# Altium schematic sheet LED_Status_Schematic.SchDoc: LED Status Schematic
size B; Date: 11/17/2026; ApprovedBy: Chris King; Author: Christopher King; Organization: ORGANIZATION; Address1: ADDRESS 1; Address2: ADDRESS 2; Address3: ADDRESS 3; Address4: ADDRESS 4; DocumentNumber: LED Status Board; Revision: -; SheetNumber: 1; SheetTotal: 3; Title2: LED Status Board; ENG_APP_DATE: --/--/--; DSN_APP_DATE: --/--/--; CHK_APP_DATE: --/--/--
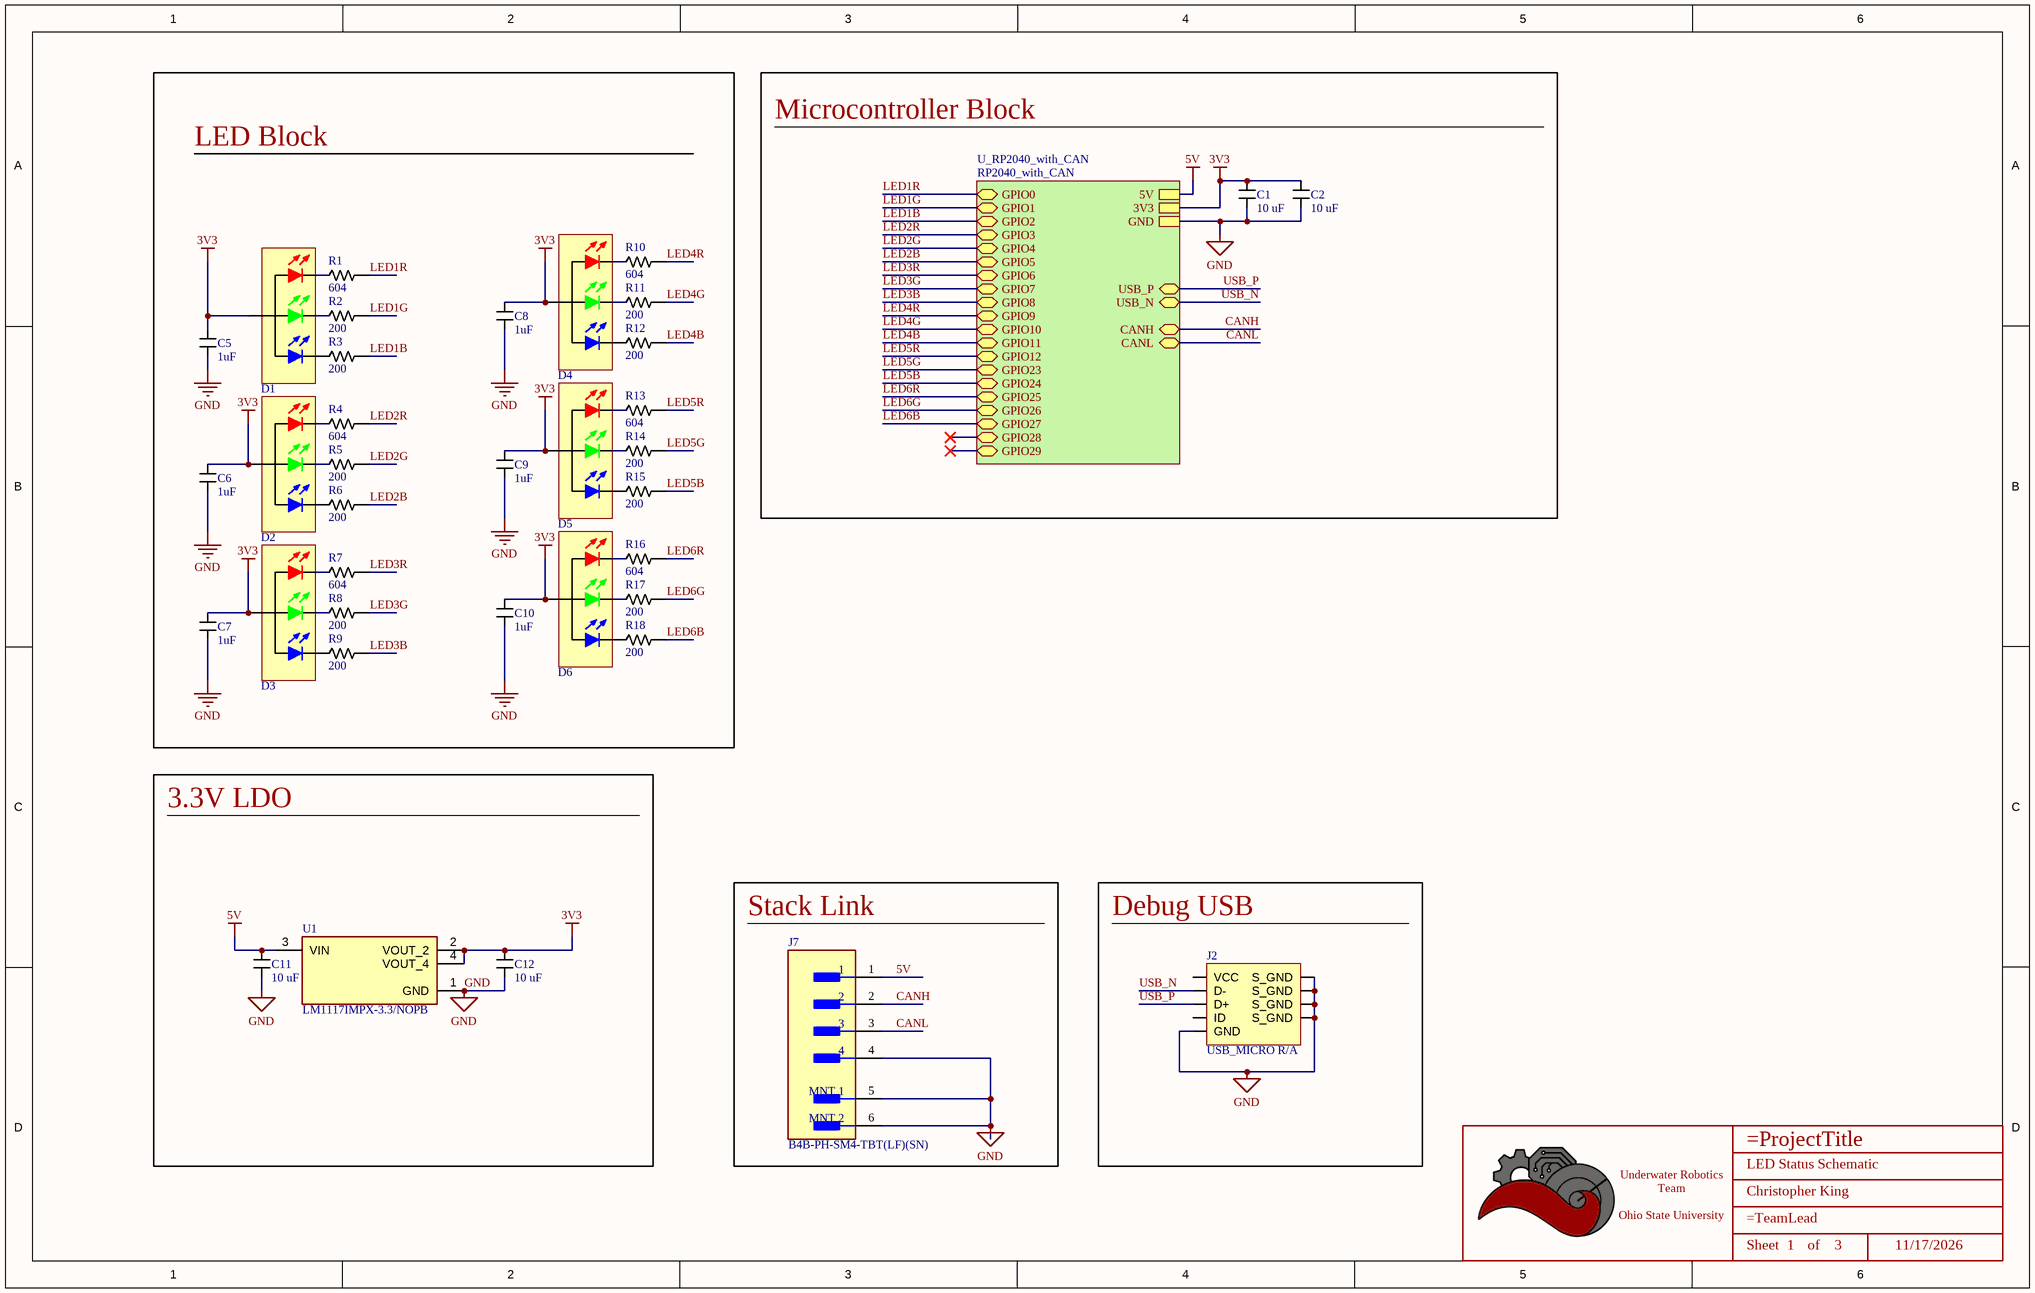
[diagram p0: LED_Status_Schematic.SchDoc]

## Parts
*  Title_Block  [LOGO]  (value not drawn)  (graphical)
C1  Value (uF): 10 uF  [CAPACITOR_0603]  (hidden comment: 10uF Ceramic 6.3V)
C2  Value (uF): 10 uF  [CAPACITOR_0603]  (hidden comment: 10uF Ceramic 6.3V)
C5  value 1uF  [CAPACITOR_0402]  (hidden comment: 1uF Ceramic 16V)
C6  value 1uF  [CAPACITOR_0402]  (hidden comment: 1uF Ceramic 16V)
C7  value 1uF  [CAPACITOR_0402]  (hidden comment: 1uF Ceramic 16V)
C8  value 1uF  [CAPACITOR_0402]  (hidden comment: 1uF Ceramic 16V)
C9  value 1uF  [CAPACITOR_0402]  (hidden comment: 1uF Ceramic 16V)
C10  value 1uF  [CAPACITOR_0402]  (hidden comment: 1uF Ceramic 16V)
C11  Value (uF): 10 uF  [CAPACITOR_0603]  (hidden comment: 10uF Ceramic 6.3V)
C12  Value (uF): 10 uF  [CAPACITOR_0603]  (hidden comment: 10uF Ceramic 6.3V)
D1  EAST1616RGBB4  [LED_0606_4SMD]  (value not drawn)
D2  EAST1616RGBB4  [LED_0606_4SMD]  (value not drawn)
D3  EAST1616RGBB4  [LED_0606_4SMD]  (value not drawn)
D4  EAST1616RGBB4  [LED_0606_4SMD]  (value not drawn)
D5  EAST1616RGBB4  [LED_0606_4SMD]  (value not drawn)
D6  EAST1616RGBB4  [LED_0606_4SMD]  (value not drawn)
J2  USB_MICRO R/A  [CONN_MINIUSB]
J7  B4B-PH-SM4-TBT(LF)(SN)  [FP-B4B-PH-SM4-TBT_LF_SN-MFG]
R1  Value  (Ohms): 604  [RESISTOR_0402]  (hidden comment: 604 Ohm 1% 1/16W)
R2  Value  (Ohms): 200  [RESISTOR_0402]  (hidden comment: 200 Ohm 1% 1/16W)
R3  Value  (Ohms): 200  [RESISTOR_0402]  (hidden comment: 200 Ohm 1% 1/16W)
R4  Value  (Ohms): 604  [RESISTOR_0402]  (hidden comment: 604 Ohm 1% 1/16W)
R5  Value  (Ohms): 200  [RESISTOR_0402]  (hidden comment: 200 Ohm 1% 1/16W)
R6  Value  (Ohms): 200  [RESISTOR_0402]  (hidden comment: 200 Ohm 1% 1/16W)
R7  Value  (Ohms): 604  [RESISTOR_0402]  (hidden comment: 604 Ohm 1% 1/16W)
R8  Value  (Ohms): 200  [RESISTOR_0402]  (hidden comment: 200 Ohm 1% 1/16W)
R9  Value  (Ohms): 200  [RESISTOR_0402]  (hidden comment: 200 Ohm 1% 1/16W)
R10  Value  (Ohms): 604  [RESISTOR_0402]  (hidden comment: 604 Ohm 1% 1/16W)
R11  Value  (Ohms): 200  [RESISTOR_0402]  (hidden comment: 200 Ohm 1% 1/16W)
R12  Value  (Ohms): 200  [RESISTOR_0402]  (hidden comment: 200 Ohm 1% 1/16W)
R13  Value  (Ohms): 604  [RESISTOR_0402]  (hidden comment: 604 Ohm 1% 1/16W)
R14  Value  (Ohms): 200  [RESISTOR_0402]  (hidden comment: 200 Ohm 1% 1/16W)
R15  Value  (Ohms): 200  [RESISTOR_0402]  (hidden comment: 200 Ohm 1% 1/16W)
R16  Value  (Ohms): 604  [RESISTOR_0402]  (hidden comment: 604 Ohm 1% 1/16W)
R17  Value  (Ohms): 200  [RESISTOR_0402]  (hidden comment: 200 Ohm 1% 1/16W)
R18  Value  (Ohms): 200  [RESISTOR_0402]  (hidden comment: 200 Ohm 1% 1/16W)
U1  LM1117IMPX-3.3/NOPB  [SOT-223-4]

## Blocks framed on the sheet
LED Block: C5-C10 D1-D6 R1-R18
Microcontroller Block: C1 C2
3.3V LDO: C11 C12 U1
Stack Link: J7
Debug USB: J2

## Sub-sheets
U_RP2040_with_CAN = RP2040_with_CAN: USB_P (bidir), USB_N (bidir), 5V, CANH (bidir), CANL (bidir), GPIO0 (bidir), GPIO1 (bidir), GPIO2 (bidir), GPIO3 (bidir), GPIO4 (bidir), GPIO5 (bidir), GPIO6 (bidir), GPIO7 (bidir), GPIO8 (bidir), GPIO9 (bidir), GPIO10 (bidir), GPIO11 (bidir), GPIO12 (bidir), GPIO23 (bidir), GPIO24 (bidir), GPIO25 (bidir), GPIO26 (bidir), GPIO27 (bidir), GPIO28 (bidir), GPIO29 (bidir), 3V3, GND

## Nets
3V3: C1.1 C2.1 C5.1 C6.1 C7.1 C8.1 C9.1 C10.1 C12.1 D1.4 D2.4 D3.4 D4.4 D5.4 D6.4 U1.2(VOUT_2) U1.4(VOUT_4) ; sheet U_RP2040_with_CAN/3V3
5V: C11.1 J7.1 U1.3(VIN) ; sheet U_RP2040_with_CAN/5V
GND: C1.2 C2.2 C5.2 C6.2 C7.2 C8.2 C9.2 C10.2 C11.2 C12.2 J2.5(GND) J2.6(S_GND) J2.7(S_GND) J2.8(S_GND) J2.9(S_GND) J7.4 J7.5(MNT_1) J7.6(MNT_2) U1.1(GND) ; sheet U_RP2040_with_CAN/GND
CANH: J7.2 ; sheet U_RP2040_with_CAN/CANH
CANL: J7.3 ; sheet U_RP2040_with_CAN/CANL
LED1B: R3.1 ; sheet U_RP2040_with_CAN/GPIO2
LED1G: R2.1 ; sheet U_RP2040_with_CAN/GPIO1
LED1R: R1.1 ; sheet U_RP2040_with_CAN/GPIO0
LED2B: R6.1 ; sheet U_RP2040_with_CAN/GPIO5
LED2G: R5.1 ; sheet U_RP2040_with_CAN/GPIO4
LED2R: R4.1 ; sheet U_RP2040_with_CAN/GPIO3
LED3B: R9.1 ; sheet U_RP2040_with_CAN/GPIO8
LED3G: R8.1 ; sheet U_RP2040_with_CAN/GPIO7
LED3R: R7.1 ; sheet U_RP2040_with_CAN/GPIO6
LED4B: R12.1 ; sheet U_RP2040_with_CAN/GPIO11
LED4G: R11.1 ; sheet U_RP2040_with_CAN/GPIO10
LED4R: R10.1 ; sheet U_RP2040_with_CAN/GPIO9
LED5B: R15.1 ; sheet U_RP2040_with_CAN/GPIO24
LED5G: R14.1 ; sheet U_RP2040_with_CAN/GPIO23
LED5R: R13.1 ; sheet U_RP2040_with_CAN/GPIO12
LED6B: R18.1 ; sheet U_RP2040_with_CAN/GPIO27
LED6G: R17.1 ; sheet U_RP2040_with_CAN/GPIO26
LED6R: R16.1 ; sheet U_RP2040_with_CAN/GPIO25
USB_N: J2.2(D-) ; sheet U_RP2040_with_CAN/USB_N
USB_P: J2.3(D+) ; sheet U_RP2040_with_CAN/USB_P
NetD1_1: D1.1 R1.2
NetD1_2: D1.2 R2.2
NetD2_1: D2.1 R4.2
NetD2_2: D2.2 R5.2
NetD3_1: D3.1 R7.2
NetD3_2: D3.2 R8.2
NetD4_1: D4.1 R10.2
NetD4_2: D4.2 R11.2
NetD5_1: D5.1 R13.2
NetD5_2: D5.2 R14.2
NetD6_1: D6.1 R16.2
NetD6_2: D6.2 R17.2

Not connected (* = marked no-connect by the designer): D1 3(32); D2 3(32); D3 3(32); D4 3(32); D5 3(32); D6 3(32); J2 1(VCC) 4(ID); R3 2; R6 2; R9 2; R12 2; R15 2; R18 2

## Notes on the sheet
- DWG. NO.
- REV.
- SHT.
- THIS DOCUMENT AND THE DATA DISCLOSED HEREIN OR HEREWITH IS THE PROPERTY OF ALTIUM LIMITED AND MAY BE FREELY DISTRIBUTED IN WHOLE. NO RIGHTS ARE RESERVED OR EXPRESS OR IMPLIED WARANTEE GIVEN.
- REVISION
- DESCRIPTION
- DATE
- APPROVED
- ENG:
- APPROVALS
- PROJECT
- DSN:
- CHK:
- REFERENCE DOCUMENTS
- PROJECT REVISION:
- TITLE
- DOCUMENT REVISION:
- DESIGN ITEM:
- BOM:
- FAB DWG:
- PCB DWG:
- ASSY DWG:
- SCALE:
- SIZE
- B
- CAGE CODE
- FILE NAME
- DWG NO.
- SHEET
- OF
- REV
- (in symbol Title_Block) Underwater Robotics Team / Ohio State University; Sheet; of

## Library data of the parts
* = Title_Block: UWRT Schematic Title Block Template / Created June 2021, Dylan Trainor
C1 C2 C11 C12 = CAPACITOR_10uF_0603: Cap 10uF 6.3V +/-20% / Ceramic 0603; Made By: Flip B; ComponentLink1Description: Digikey; ComponentLink1URL: https://www.digikey.com/en/products/detail/samsung-electro-mechanics/CL10A106MQ8NNNC/3886777; Supplier 1: Digi-Key; Supplier Part Number 1: 1276-1119-1-ND; Tolerance: +/- 20%; Voltage: 6.3V
C5-C10 = CAPACITOR_1uF_0402: Cap 1uF 16V +/-10% / Ceramic 0402; Made By: Robert Pafford; Tolerance: +/- 10%; Voltage: 16V; Supplier 1: Digi-Key; Supplier Part Number 1: 478-0402YD105KAT4ADKR-ND
D1-D6 = LED_RGB_4SMD: LED RGB CLEAR 4SMD; Made By: Robert Pafford; Red Forward Voltage: 1.8V; Red Forward Current: 5mA; Green Forward Voltage: 2.8V; ComponentLink1Description: Datasheet; ComponentLink1URL: https://everlightamericas.com/index.php?controller=attachment&id_attachment=3220; Package: 4-SMD; Green Forward Current: 5mA; Blue Forward Voltage: 2.8V; Blue Forward Current: 5mA; Color: RGB; Supplier 1: Digi-Key; Supplier Part Number 1: 1080-1552-1-ND
J2 = CONN_MICROUSB: Amphenol Micro USB-B / USB2.0 5 Pin Right Angle SMD; Pitch: 0.65mm; Current Per Pin: 1.8A; Number of Positions: 5; Manufacturer: Amphenol; Configuration: Right Angle; Color: Silver; Created By: Flip B; ComponentLink1Description: Datasheet; ComponentLink1URL: https://cdn.amphenol-icc.com/media/wysiwyg/files/documentation/datasheet/inputoutput/io_usb_micro.pdf?__cf_chl_jschl_tk__=05693735e19256298f6ef6ca2bb2e65c376a4f56-1625503833-0-Abitsb0-ufjOXJYs_S3J3r2iTn-nObalbmXUksF1VvO_h_WEmRdMlUD1I8-hmWSEVWzY1pirKnrPZWfgY3851qyBZe5ZvnNQePLGIzUgdEIQBVUyW36RsbYpDLEWxJ4horD-5gChFgobLYqwmG5aHl0E8lIn_twwPPrOxilK2gP0q9t_CNOs_u5fMqXvXUrlsOv8tIE2NRlu6NVP8qtkL2GjhlkeTUbDMF8WvvpPDTFOgvZ4Y16Ej8F8AhWos88mo5B1HssXozw0XrkJQIqERITUu6rqloz9kf4ZzhBHtDAt-IkiAFY_Ds9SW8FYKKTtINJVpHZQ6Gyu1FFM4Dc9MO0maE8_mmNcwlxqyRoRk_MPWW8VyByXWM5RSp52jteRKw7FeI9WIYvCbPAOy0Eyib-aseIQsnGbglBcUY6_2xp8GYaJM38H3dNvBPsSOfJBPndKedwKHllxjkucXn6xsN0sDXkpGN-cu8_2bDTJ0g-uUucKSCooYX-ApSDNGpkA_p9zv1SOAD8c0zaZVmtiBsN75QpVz2rzq9_BFxOywPvR; Series: 10118192; Supplier 1: Digi-Key; Supplier Part Number 1: 609-4613-1-ND
J7 = CMP-17439-000271-1: CONN HEADER SMD 4POS 2MM; Voltage Rating: 100V; Contact Resistance: 20mR; Mated Stacking Heights: 8.6mm; Number of Positions: 4; Max Current Rating: 2A; Color: Natural; Connector Type: Header; Mount: Surface Mount; Contact Finish - Mating: TIN; Contact Material: Copper Alloy; Contact Mating Length: 0.13inch; Contact Plating: Copper; Max Operating Temperature: 85°C; Termination: Solder; Fastening Type: Detent; Min Operating Temperature: -25°C; Contact Shape: Square; Flammability Rating: UL94 V-0; Housing Material: Polyamide; Contact Type: Male Pin; Housing Color: Beige; Depth: 5mm; Packaging: Tape and Reel; Number of Rows: 1; Insulation Color: Natural; Length: 11.95mm; Max Voltage Rating (AC): 100V; Orientation: Straight; Insulation Material: Nylon; Pitch: 2mm; Package Quantity: 1; Series: PH; Lead Free: Lead Free
R1 R4 R7 R10 R13 R16 = RESISTOR_604_0402: RES 604 OHM 1% 1/16W 0402; Tolerance: +/- 1%; Made By: Robert Pafford; Wattage: 1/16W; Supplier: Digikey; Digikey Part Numer: CR0603-JW-104ELFTR-ND; Supplier 1: Digi-Key; Supplier Part Number 1: 13-AC0402FR-07604RLCT-ND
R2 R3 R5 R6 R8 R9 R11 R12 R14 R15 R17 R18 = RESISTOR_200_0402: RES 200 OHM 1% 1/16W 0402; Tolerance: +/- 1%; Made By: Robert Pafford; Wattage: 1/16W; Supplier: Digikey; Digikey Part Numer: CR0603-JW-104ELFTR-ND; Supplier 1: Digi-Key; Supplier Part Number 1: YAG3453CT-ND
U1 = LM1117IMPX-3.3/NOPB: 800-mA 15-V linear voltage regulator 4-SOT-223 -40 to 125; MF: Texas Instruments; Texas_Instruments-Purchase-URL: https://snapeda.com/shop?store=Texas+Instruments&id=410186; Price: None; Mouser-Purchase-URL: https://snapeda.com/shop?store=Mouser&id=410186; MP: LM1117IMPX-3.3/NOPB; Value: *; Availability: Good; Package: SOT-223-4 Texas Instruments; Arrow_Electronics-Purchase-URL: https://snapeda.com/shop?store=Arrow+Electronics&id=410186; SnapEDA_Link: https://www.snapeda.com/parts/LM1117IMPX-3.3/NOPB/Texas%20Instruments/view-part/410186/?ref=snap; DigiKey-Purchase-URL: https://snapeda.com/shop?store=DigiKey&id=410186